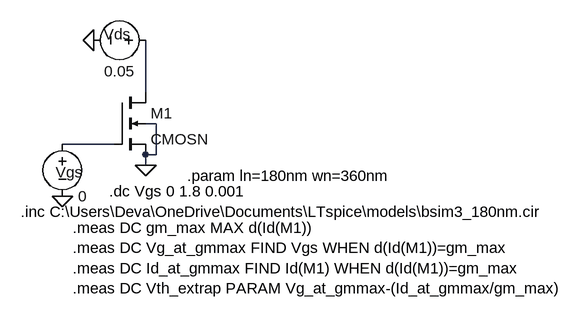
[diagram p0: schematic vth.asc]
vth.asc, the LTspice schematic file:
Version 4.1
SHEET 1 880 680
WIRE 160 96 160 16
WIRE 176 144 160 144
WIRE 112 176 32 176
WIRE 176 192 176 144
WIRE 176 192 160 192
WIRE 160 208 160 192
FLAG 160 208 0
FLAG 80 16 0
FLAG 32 256 0
SYMBOL nmos4 112 96 R0
SYMATTR InstName M1
SYMATTR Value2 l={ln} w={wn}
SYMATTR Value CMOSN
SYMBOL voltage 32 160 R0
WINDOW 0 -10 59 Left 2
WINDOW 123 0 0 Left 0
WINDOW 39 0 0 Left 0
SYMATTR InstName Vgs
SYMATTR Value 0
SYMBOL voltage 176 16 R90
WINDOW 0 6 60 VBottom 2
WINDOW 3 32 56 VTop 2
WINDOW 123 0 0 Left 0
WINDOW 39 0 0 Left 0
SYMATTR InstName Vds
SYMATTR Value 0.05
TEXT 104 248 Left 2 !.dc Vgs 0 1.8 0.001
TEXT -32 280 Left 2 !.inc C:\\Users\\Deva\\OneDrive\\Documents\\LTspice\\models\\bsim3_180nm.cir
TEXT 224 224 Left 2 !.param ln=180nm wn=360nm
TEXT 48 304 Left 2 !.meas DC gm_max MAX d(Id(M1))\n.meas DC Vg_at_gmmax FIND Vgs WHEN d(Id(M1))=gm_max\n.meas DC Id_at_gmmax FIND Id(M1) WHEN d(Id(M1))=gm_max\n.meas DC Vth_extrap PARAM Vg_at_gmmax-(Id_at_gmmax/gm_max)

The netlist it stands for:
* vth.asc
M1 N001 N002 0 0 CMOSN l={ln} w={wn}
Vgs N002 0 0
Vds N001 0 0.05
.model NMOS NMOS
.model PMOS PMOS
.lib standard.mos
.dc Vgs 0 1.8 0.001
.inc C:\Users\Deva\OneDrive\Documents\LTspice\models\bsim3_180nm.cir
.param ln=180nm wn=360nm
.meas DC gm_max MAX d(Id(M1))
.meas DC Vg_at_gmmax FIND Vgs WHEN d(Id(M1))=gm_max
.meas DC Id_at_gmmax FIND Id(M1) WHEN d(Id(M1))=gm_max
.meas DC Vth_extrap PARAM Vg_at_gmmax-(Id_at_gmmax/gm_max)
.backanno
.end